# EAGLE design robotshellid (EAGLE 9.6.2)
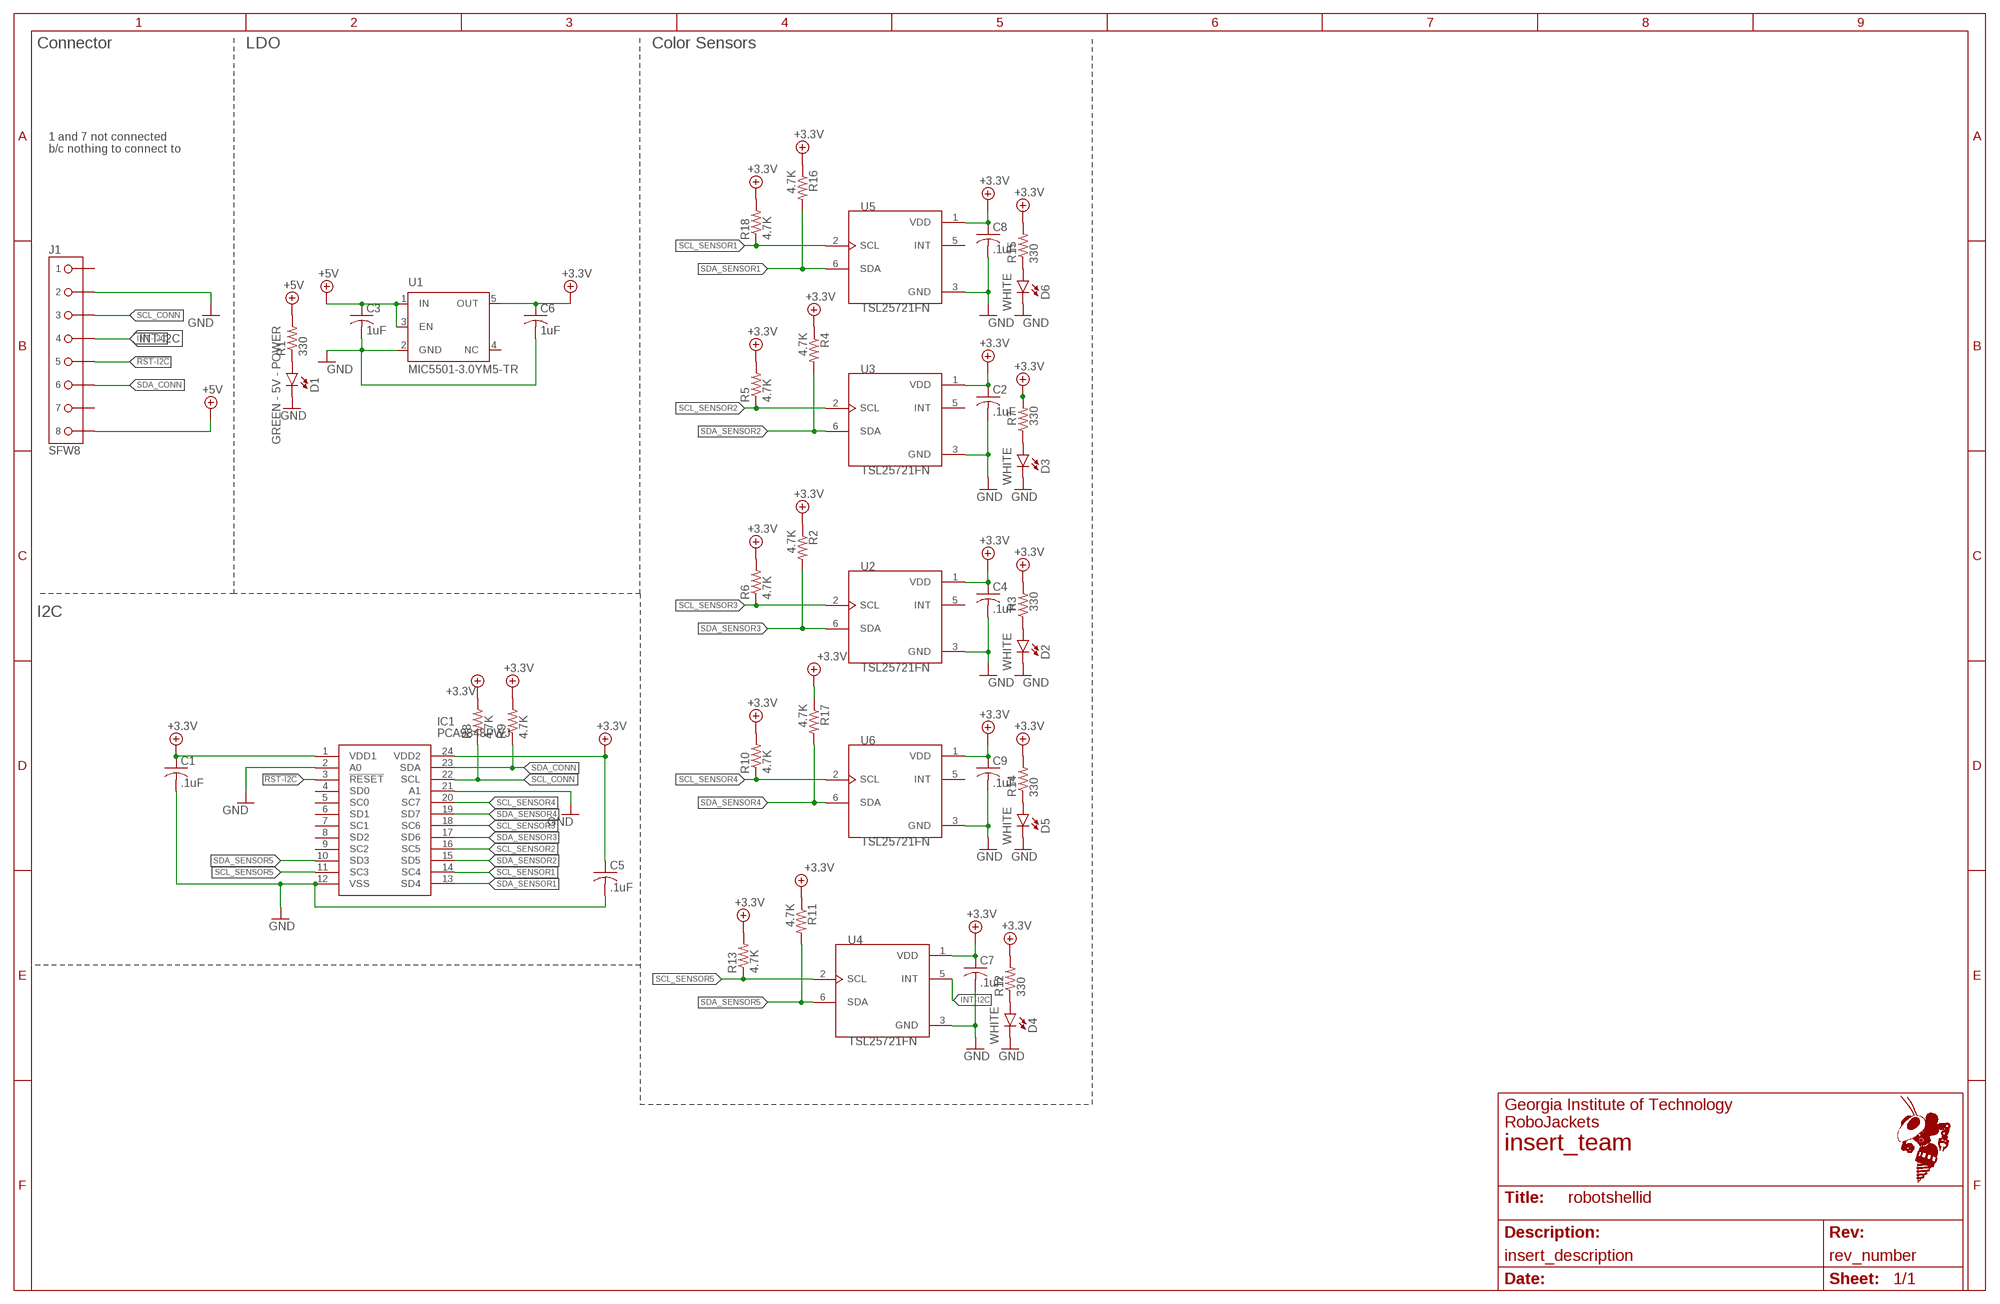
[diagram p0: schematic, sheet 1]
FRAME1 (FRAME_11_17): REVISION: rev_number; SCH_DESC: insert_description; TEAM: insert_team

## Parts
C1  .1uF  C-USC0603  [C0603]
C2  .1uF  C-USC0603  [C0603]
C3  1uF  C-USC0603  [C0603]
C4  .1uF  C-USC0603  [C0603]
C5  .1uF  C-USC0603  [C0603]
C6  1uF  C-USC0603  [C0603]
C7  .1uF  C-USC0603  [C0603]
C8  .1uF  C-USC0603  [C0603]
C9  .1uF  C-USC0603  [C0603]
D1  GREEN - 5V - POWER  LED-SMD  [LED0603]
D2  WHITE  LED-SMD  [LED0603]
D3  WHITE  LED-SMD  [LED0603]
D4  WHITE  LED-SMD  [LED0603]
D5  WHITE  LED-SMD  [LED0603]
D6  WHITE  LED-SMD  [LED0603]
IC1  PCA9848PWJ  [SOP65P640X110-24N]
J1  SFW8  [SFW8R-1ST]
R1  330  R-US_R0603  [R0603]
R2  4.7K  R-US_R0603  [R0603]
R3  330  R-US_R0603  [R0603]
R4  4.7K  R-US_R0603  [R0603]
R5  4.7K  R-US_R0603  [R0603]
R6  4.7K  R-US_R0603  [R0603]
R7  330  R-US_R0603  [R0603]
R8  4.7K  R-US_R0603  [R0603]
R9  4.7K  R-US_R0603  [R0603]
R10  4.7K  R-US_R0603  [R0603]
R11  4.7K  R-US_R0603  [R0603]
R12  330  R-US_R0603  [R0603]
R13  4.7K  R-US_R0603  [R0603]
R14  330  R-US_R0603  [R0603]
R15  330  R-US_R0603  [R0603]
R16  4.7K  R-US_R0603  [R0603]
R17  4.7K  R-US_R0603  [R0603]
R18  4.7K  R-US_R0603  [R0603]
U1  MIC5501-3.0YM5-TR  [SOT-23-5]
U2  TSL25721FN  [SON65P200X200X70-6N]
U3  TSL25721FN  [SON65P200X200X70-6N]
U4  TSL25721FN  [SON65P200X200X70-6N]
U5  TSL25721FN  [SON65P200X200X70-6N]
U6  TSL25721FN  [SON65P200X200X70-6N]

## Nets
!RST-I2C!: IC1.3(!RESET) J1.5
+3.3V: C1.1 C2.1 C4.1 C5.1 C6.1 C7.1 C8.1 C9.1 IC1.1(VDD1) IC1.24(VDD2) R2.1 R3.2 R4.1 R5.2 R6.2 R7.2 R8.2 R9.2 R10.2 R11.1 R12.2 R13.2 R14.2 R15.2 R16.1 R17.1 R18.2 U1.5(OUT) U2.1(VDD) U3.1(VDD) U4.1(VDD) U5.1(VDD) U6.1(VDD)
+5V: C3.1 J1.8 R1.2 U1.1(IN) U1.3(EN)
GND: C1.2 C2.2 C3.2 C4.2 C5.2 C6.2 C7.2 C8.2 C9.2 D1.C D2.C D3.C D4.C D5.C D6.C IC1.2(A0) IC1.12(VSS) IC1.21(A1) J1.2 U1.2(GND) U2.3(GND) U3.3(GND) U4.3(GND) U5.3(GND) U6.3(GND)
INT-I2C: J1.4 U4.5(INT)
N$1: D6.A R15.1
N$3: D3.A R7.1
N$4: D4.A R12.1
N$5: D2.A R3.1
N$7: D5.A R14.1
N$9: D1.A R1.1
SCL_CONN: IC1.22(SCL) J1.3 R8.1
SCL_SENSOR1: IC1.14(SC4) R18.1 U5.2(SCL)
SCL_SENSOR2: IC1.16(SC5) R5.1 U3.2(SCL)
SCL_SENSOR3: IC1.18(SC6) R6.1 U2.2(SCL)
SCL_SENSOR4: IC1.20(SC7) R10.1 U6.2(SCL)
SCL_SENSOR5: IC1.11(SC3) R13.1 U4.2(SCL)
SDA_CONN: IC1.23(SDA) J1.6 R9.1
SDA_SENSOR1: IC1.13(SD4) R16.2 U5.6(SDA)
SDA_SENSOR2: IC1.15(SD5) R4.2 U3.6(SDA)
SDA_SENSOR3: IC1.17(SD6) R2.2 U2.6(SDA)
SDA_SENSOR4: IC1.19(SD7) R17.2 U6.6(SDA)
SDA_SENSOR5: IC1.10(SD3) R11.2 U4.6(SDA)
Unconnected: IC1.4(SD0) IC1.5(SC0) IC1.6(SD1) IC1.7(SC1) IC1.8(SD2) IC1.9(SC2) J1.1 J1.7 J1.LEG1 J1.LEG2 U1.4(NC) U2.5(INT) U3.5(INT) U5.5(INT) U6.5(INT)

## Notes on the sheet
- Connector | LDO | Color Sensors
- 1 and 7 not connected
  b/c nothing to connect to
- I2C

## Library data of the parts
C1-C9 = rcl:C-US: CAPACITOR, American symbol; SPICEPREFIX: C
D1-D6 = RoboJackets-LEDs:LED-SMD: Series of 0603 LEDs
IC1 = SamacSys_Parts:PCA9848PWJ: NXP - PCA9848PWJ - SWITCH, DUAL, 8:1, TSSOP-24 Source: Datasheet <http://www.nxp.com/docs/en/data-sheet/PCA9848.pdf>; DESCRIPTION: NXP - PCA9848PWJ - SWITCH, DUAL, 8:1, TSSOP-24; HEIGHT: 1.1mm; MANUFACTURER_NAME: NXP; MANUFACTURER_PART_NUMBER: PCA9848PWJ; MOUSER_PART_NUMBER: 771-PCA9848PWJ; MOUSER_PRICE-STOCK: https://www.mouser.co.uk/ProductDetail/NXP-Semiconductors/PCA9848PWJ?qs=%252BRKXB2WKlSeUIK8RAkv%2F8w%3D%3D
J1 = RoboJackets-Connectors:SFW8
R1-R18 = rcl:R-US_: RESISTOR, American symbol; SPICEPREFIX: R
U1 = RoboJackets-PowerICs:MIC5501-3.0YM5-TR: Linear Voltage Regulator IC 1 Output 300mA SOT-23-5 Datasheet <https://ww1.microchip.com/downloads/en/DeviceDoc/MIC5501-02-03-04-300mA-Single-Output-LDO-in-Small-Packages-DS20006006B.pdf>; DKPN: 576-4905-1-ND
U2-U6 = TSL25721FN:TSL25721FN: Ic Light To Dgtl Conv Als 6dfn Check prices <https://pricing.snapeda.com/parts/TSL25721FN/ams/view-part?ref=eda>; AVAILABILITY: In Stock; DESCRIPTION: Optical Sensor Ambient 4000K I²C 6-WDFN; MF: ams; MP: TSL25721FN; PACKAGE: DFN-6 ams; PRICE: None; PURCHASE-URL: https://pricing.snapeda.com/search/part/TSL25721FN/?ref=eda

## Board
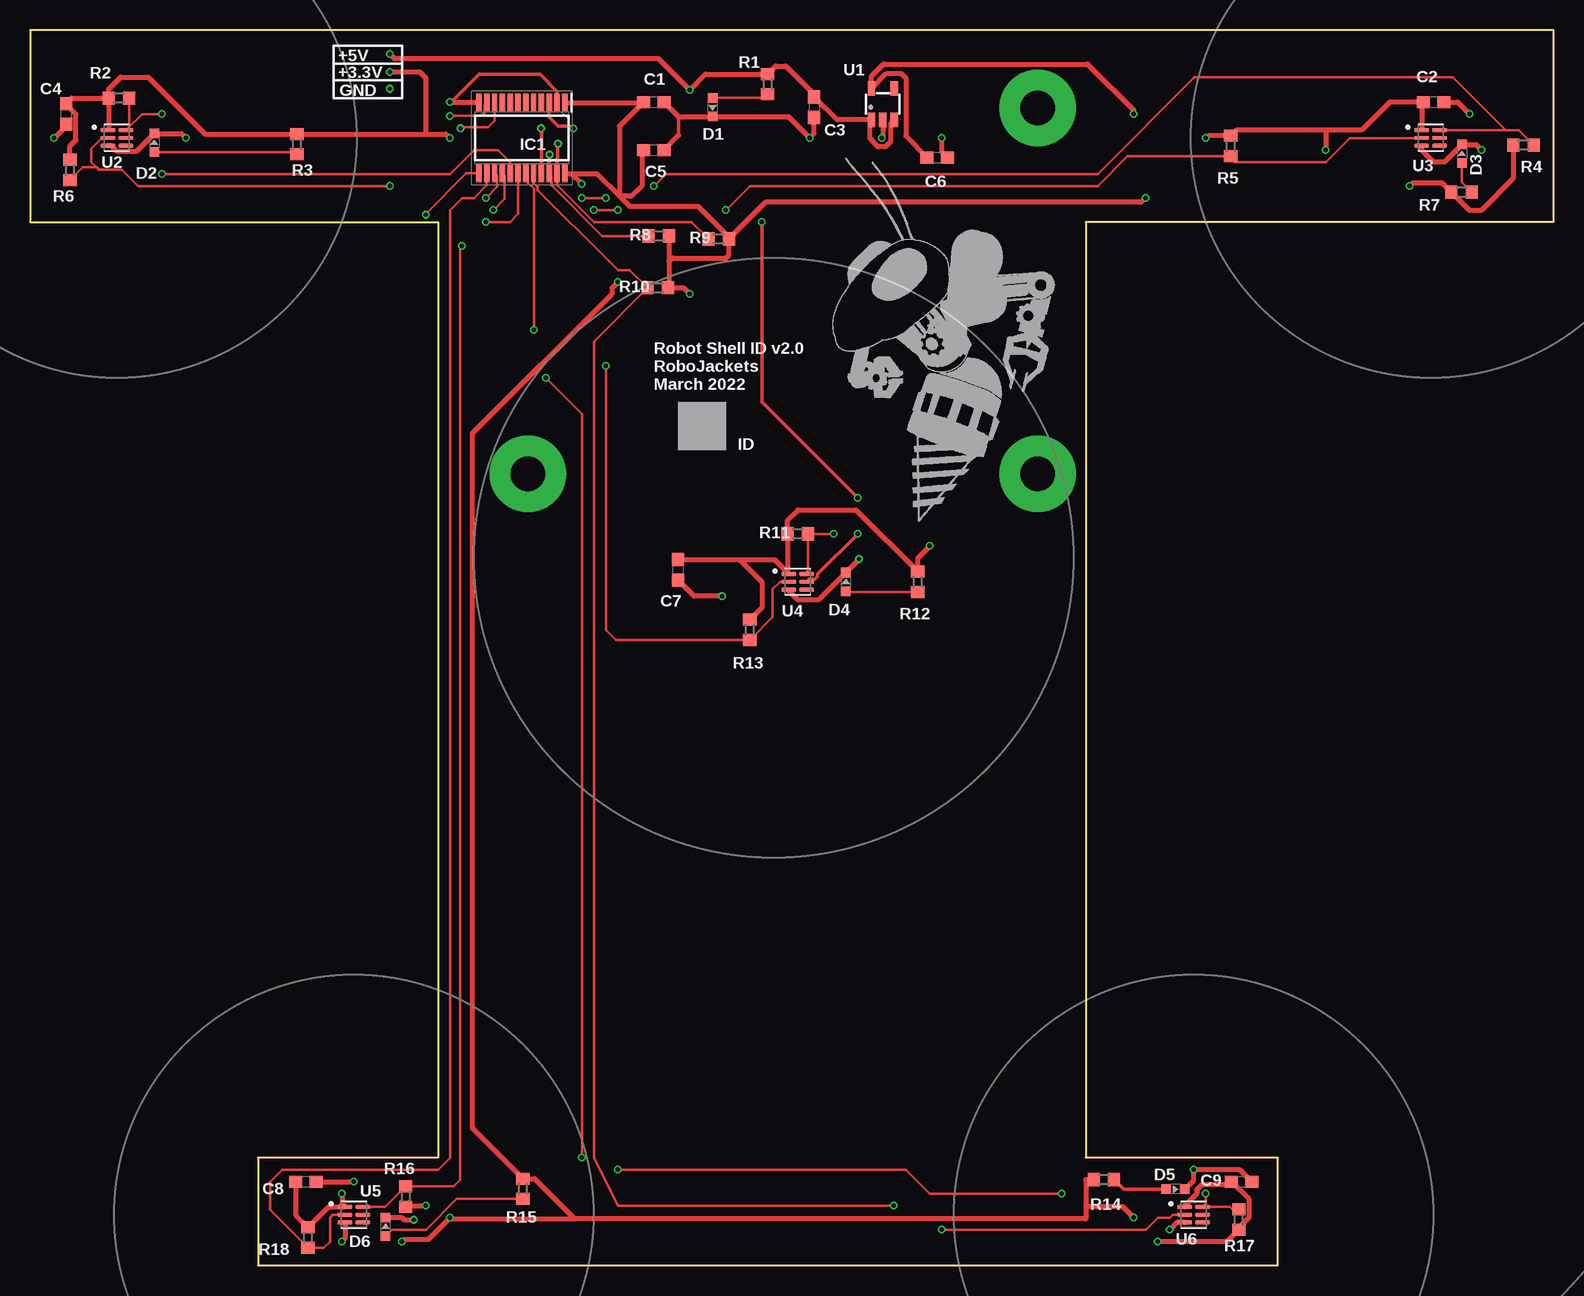
[diagram p1: board, top side]
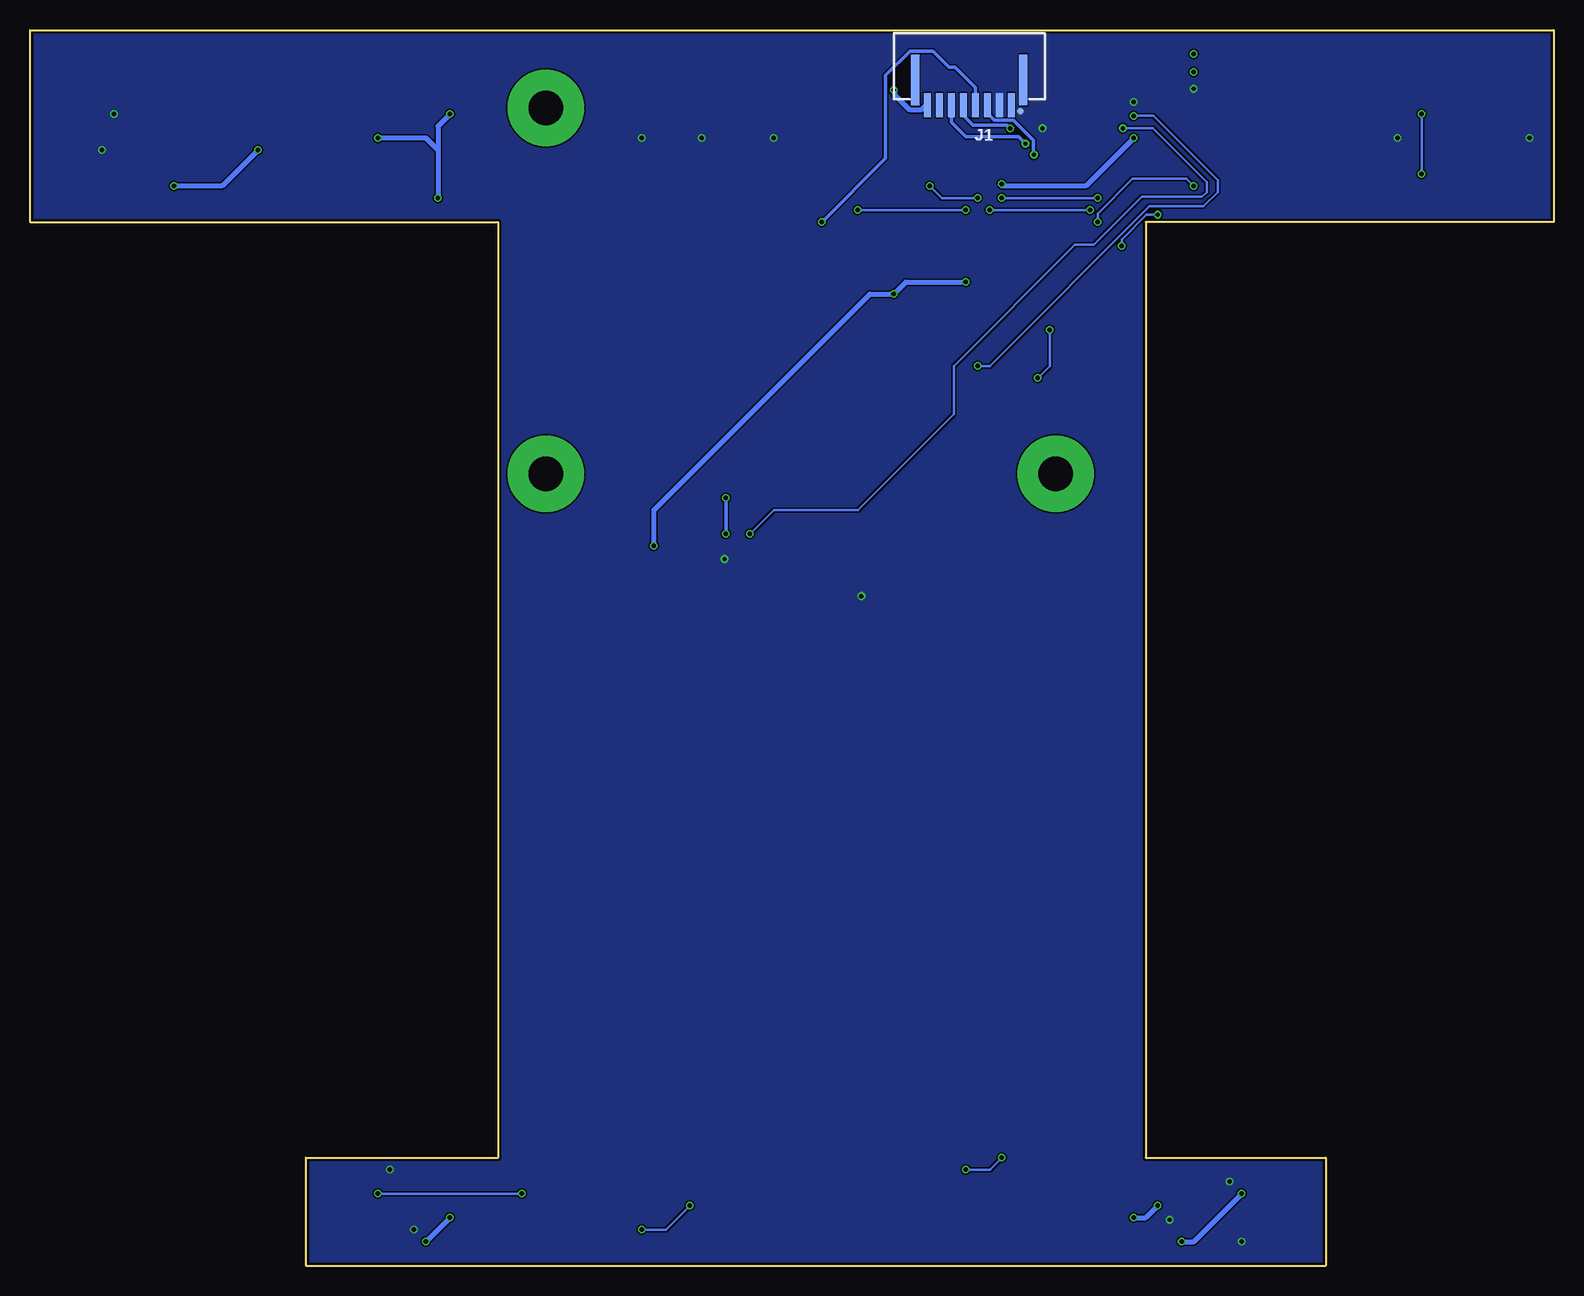
[diagram p2: board, bottom side, seen from below]

Size 127 x 103 mm. Coordinates in mm from the lower left corner, seen from the top.
Outline: 127,87 127,103 0,103 0,87 34,87 34,9 19,9 19,0 104,0 104,9 88,9 88,87 127,87
Copper layers (1+16): Top 0.035mm / dielectric 1.53mm / Bottom 0.035mm
Design rules "JLCPCB (2 Layer)": minimum track width 5mil, minimum drill 0.3mm, track to track 5mil, track to pad 5mil, pad to pad 5mil, via to via 20mil, smd to smd 5mil, copper to edge 0.2mm, drill to drill 21mil, minimum pad ring 6mil, minimum via ring 6mil, stop-mask expansion 2mil, vias tented up to drill 30mil, thermal gap 10mil

### Footprints (pad centres in the part's own frame; a part is rotated, then mirrored left to right if it is on the bottom)
C0603 = smd 1.1 x 1: 1 -0.85,0; 2 0.85,0
LED0603 = smd 0.8 x 0.8: A -0.775,0; C 0.775,0
SOP65P640X110-24N = smd 1.475 x 0.45: 1 -2.938,3.575; 2 -2.938,2.925; 3 -2.938,2.275; 4 -2.938,1.625; 5 -2.938,0.975; 6 -2.938,0.325; 7 -2.938,-0.325; 8 -2.938,-0.975; 9 -2.938,-1.625; 10 -2.938,-2.275; 11 -2.938,-2.925; 12 -2.938,-3.575; 13 2.938,-3.575; 14 2.938,-2.925; 15 2.938,-2.275; 16 2.938,-1.625; 17 2.938,-0.975; 18 2.938,-0.325; 19 2.938,0.325; 20 2.938,0.975; 21 2.938,1.625; 22 2.938,2.275; 23 2.938,2.925; 24 2.938,3.575
SFW8R-1ST = smd 0.6 x 2: 1 -3.5,3.25; 2 -2.5,3.25; 3 -1.5,3.25; 4 -0.5,3.25; 5 0.5,3.25; 6 1.5,3.25; 7 2.5,3.25; 8 3.5,3.25 | smd 0.7 x 4.2: LEG1 -4.5,1.15; LEG2 4.5,1.15
R0603 = smd 1 x 1.1: 1 -0.85,0; 2 0.85,0
SOT-23-5 = smd 0.6 x 1.2: 1 -0.95,-1.306; 2 0,-1.306; 3 0.95,-1.306; 4 0.95,1.306; 5 -0.95,1.306
SON65P200X200X70-6N = smd 1.24 x 0.32: 1 -0.745,0.65; 2 -0.745,0; 3 -0.745,-0.65; 4 0.745,-0.65; 5 0.745,0; 6 0.745,0.65

### Placement (x,y rotation side)
C1  52,97 0 top
C2  117,97 0 top
C3  65.37,96.56 270 top
C4  3,96 270 top
C5  52,93 0 top
C6  75.63,92.37 0 top
C7  54,58 270 top
C8  23,7 0 top
C9  101,7 0 top
D1  56.9,96.56 270 top
D2  10.36,93.6 90 top
D3  119.36,92.68 90 top
D4  68,57 90 top
D5  95.48,6.36 0 top
D6  29.64,3.24 90 top
IC1  41,94 270 top
J1  48.7,100 180 bottom
R1  61.49,98.48 90 top
R2  7.41,97.32 0 top
R3  22.25,93.48 90 top
R4  124.49,93.4 0 top
R5  100.09,93.32 90 top
R6  3.33,91.32 90 top
R7  119.33,89.48 180 top
R8  52.4,85.83 0 top
R9  57.4,85.59 0 top
R10  52.32,81.51 0 top
R11  64,61 0 top
R12  74,57 90 top
R13  60,53 90 top
R14  89.52,7.17 180 top
R15  41.09,6.4 90 top
R16  31.32,5.75 90 top
R17  100.76,3.82 90 top
R18  23.17,2.32 90 top
U1  71.09,96.81 0 top
U2  7.24,94 0 top
U3  116.76,94 0 top
U4  64,57 0 top
U5  27,4.24 0 top
U6  97,4.24 0 top
U$1  [ROBOBUZZ_1.4X]  74,62 0 top

### Tracks (layer width: path | path; a pad name or v marks a point on that pad's centre or on a via)
!RST-I2C!  (via drill 0.35)
  Top 0.3: v45.29,94.79 45.08,95 44,95 43.27,95.72 IC1.3
  Bottom 0.3: v45.29,94.79 45.55,95.05 48.39,95.05 49.2,95.86 J1.5
+3.3V  (via drill 0.35)
  Top 0.4: 108,94.65 111,94.65 113.35,97 C2.1 116.02,96.87 U3.1 | 108,94.65 100.57,94.65 R5.2 98.17,94.17 v98,94 | R9.2 58.25,84.25 58,84 53.58,84 53.29,83.71 53.25,83.75 | 45.41,3.89 42.04,7.25 R15.2 36.89,11.45 36.89,69.39 48.5,81 48.5,81.5 v49,82 | 34.94,3.89 35.02,3.98 v35,4 | 34.94,3.89 33.23,2.18 31.18,2.18 v31,2 | v92,96 92,96.33 88.17,100.17 71.17,100.17 70.14,99.14 U1.5 71.41,99.39 72.61,99.39 73,99 73,94.15 C6.1 | R9.2 61.29,88.63 92.63,88.63 v93,89 | v55,81 54.49,81.51 R10.2 53.25,81.59 53.25,83.75 | 108,94.65 v108,93 | v115,90 115.24,90.24 117.72,90.24 R7.2 119.96,88 121,88 123.64,90.64 R4.1 | R2.1 6.56,98.08 7.56,99.07 9.84,99.07 14.59,94.33 R3.2 33,94.33 | R9.2 58.25,85.75 55.72,88.28 50,88.28 49.14,89.14 | 33,94.33 34.67,94.33 v35,94 | 88,4.89 91.11,4.89 v92,4 | 45.41,3.89 88,3.89 88,4.89 | R14.2 88,7.16 88,4.89 | 49.14,89.14 47.28,91 45.16,91 | R8.2 53.25,83.75 | v33,5 31.42,5 R16.1 | 34.94,3.89 45.41,3.89 | v94,2 99.79,2 R17.1 100.76,3.15 101.64,4.03 101.64,5.51 C9.1 99.88,6.73 97.7,6.73 97.27,6.3 97.27,6 96.26,4.99 U6.1 | C8.1 22.15,4.19 R18.2 24.89,4.89 U5.1 26,5.14 v26,6 | C5.1 51,92.85 51,90 50.14,89.14 49.14,89.14 | R2.1 3.47,97.32 C4.1 3.83,96.02 3.83,93.79 3.33,93.29 R6.2 | 49.14,89.14 49.14,94.99 C1.1 51.09,96.94 IC1.1 | IC1.24 44.64,91 45.16,91 | R2.1 6.56,94.72 U2.1 | v46,90.16 45.16,91 | 33,94.33 33,99 32.5,99.5 v30,99.5 | 63.15,57.76 62.05,58.85 C7.1 59.15,58.85 61,57 61,54.85 R13.2 | v75,60 74,59 R12.2 68.85,63 64,63 63.15,62.15 R11.1 63.15,57.76 | 63.15,57.76 U4.1
  Bottom 0.4: v49,82 54,82 v55,81 57,81 75,63 v75,60 | v108,93 111,90 v115,90 | v31,2 30,2 v26,6 | v94,2 v92,4 | v35,4 34,4 v33,5 | v92,96 93,95 93,93 | 93,93 v93,89 | 93,93 94,94 v98,94 | v46,90.16 46,90 39,90 v35,94
+5V  (via drill 0.35)
  Top 0.4: U1.1 70,95.5 | 70,95.5 67.28,95.5 C3.1 65.37,97.63 63,100 62.16,100 R1.2 56.33,99.33 v55,98 52.4,100.6 30.4,100.6 v30,101 | U1.3 71.73,95.2 71.73,93.7 71.3,93.27 70.7,93.27 70.27,93.7 70.27,93.73 70,94 70,95.5
  Bottom 0.4: v55,98 54.93,97.93 54.93,97.59 53.71,96.37 52.69,96.37 52.32,96.75 J1.8
BOLT1  (via drill 2.85 pad 6.4)
  other vias: 84,96.5
BOLT2  (via drill 2.85 pad 6.4)
  other vias: 84,66
BOLT3  (via drill 2.85 pad 6.4)
  other vias: 41.5,66
GND  (via drill 0.35)
  Top 0.2: 63.26,56.24 U4.3
  Top 0.3: IC1.21 42.62,94.78 v42.6,94.8 | IC1.2 43.92,97.88 42.5,99.3 37.42,99.3 35.06,96.94 | 54.06,94.22 54.06,95.78
  Top 0.4: C3.2 65.37,94.37 v65,94 63.22,95.78 D1.C 54.06,95.78 C1.2 | U1.2 71.09,94.09 v71,94 | C6.2 76,92.85 v76,94 | D5.C 97,7.1 v97,8 100.85,8 C9.2 | v121,93 120.55,93.45 D3.C 117.91,92 117,92 116.02,92.98 U3.3 | v13,94 12.62,94.38 D2.C 8.85,92.86 7.27,92.86 6.78,93.35 U2.3 | D6.C 30.98,4.02 31.18,3.82 v32,3.82 | IC1.12 35.06,96.94 v35,97 | C5.2 54.06,94.22 | C4.2 3,95 v2,94 | U5.3 26.25,2.25 v26,2 | C8.2 v27,7 | U6.3 95.59,3.59 v95,3 | C2.2 119,97 v120,96 | 63.26,56.24 64,55.5 65.72,55.5 D4.C 69.1,58.88 v69.1,58.9 | v57.7,55.8 55.35,55.8 C7.2
  other vias: 30,98.1
  pour Bottom (no thermals): 0,103 127,103 127,87 88,87 88,9 104,9 104,0 19,0 19,9 34,9 34,87 0,87
INT-I2C  (via drill 0.35)
  Top 0.3: U4.5 64.96,57.21 65.43,57.21 65.64,57.42 65.64,57.64 v69,61 | v69,64 61,72 v61,87
  Bottom 0.3: v69,61 v69,64 | v61,87 55.68,92.32 55.68,99.21 53.66,101.23 51.73,101.23 50.41,99.9 49.9,99.9 48.2,98.2 J1.4
N$1
  Top 0.2: D6.A 30.18,3 33,3 35.55,5.55 R15.1
N$3
  Top 0.2: D3.A 119.36,90.3 R7.1
N$4
  Top 0.2: D4.A 68.08,56.15 R12.1
N$5
  Top 0.2: D2.A 22.05,92.83 R3.1
N$7
  Top 0.3: D5.A 91.18,6.36 R14.1
N$9
  Top 0.2: R1.1 61.2,97.34 D1.A
SCL_CONN  (via drill 0.35)
  Top 0.2: IC1.22 43.47,90.86 43.47,90.06 47.71,85.83 R8.1
  Top 0.3: IC1.22 43.27,92.57 v43.31,92.6
  Bottom 0.3: v43.31,92.6 43.34,92.64 43.34,93.81 45.01,95.47 46.62,95.47 47.2,96.06 J1.3
SCL_SENSOR1
  Top 0.2: U5.2 25.24,4.24 25,4 25,2 24.47,1.47 R18.1 20,4.64 20,7 21,8 34,8 35,9 35,88 36,89 37,89 38.08,90.08 IC1.14
SCL_SENSOR2  (via drill 0.35)
  Top 0.2: U3.2 110,94 108,92 100.47,92 100,92.47 | R5.1 100,92.47 | 100,92.47 91.47,92.47 89,90 60,90 v58,88 | v49,88 v47,88 | v38.63,88 39.57,88.94 39.57,90.86 IC1.16
  Bottom 0.2: v58,88 v49,88 | v47,88 v38.63,88
SCL_SENSOR3  (via drill 0.35)
  Top 0.2: U2.2 6,94 5.11,93.11 5.11,92 5.55,91.55 | v30,90 9,90 7.63,91.37 5.74,91.37 5.55,91.55 | R6.1 4.41,91.55 5.55,91.55 | v38,87 40,87 40.67,87.67 IC1.18
  Bottom 0.2: v30,90 30.6,90.6 35.1,90.6 38,87.7 v38,87
SCL_SENSOR4  (via drill 0.35)
  Top 0.2: v72,5 49,5 47,9 47,77.04 R10.1 49.98,83 49,83 48.28,83.72 48.25,83.72 42.33,89.65 42.33,89.89 41.98,90.24 IC1.20 | U6.2 95.25,4.24 95.01,4 94,4 93,3 v76,3
  Bottom 0.2: v76,3 74,3 v72,5
SCL_SENSOR5  (via drill 0.35)
  Top 0.2: U4.2 62.5,57 61.9,56.4 61.9,54.05 R13.1 48.85,52.15 48,53 v48,75 | IC1.11 37.88,96.74 37.88,96.11 37.61,95.84 v35,95.84
  Bottom 0.2: v48,75 47,75 33.7,88.3 29.2,88.3 28,89.5 28,90.5 33.34,95.84 v35,95.84
SDA_CONN  (via drill 0.35)
  Top 0.2: R9.1 55.14,87 47,87 43.92,90.08 IC1.23
  Top 0.3: IC1.23 43.92,92.26 43.99,92.32 43.99,93.49 v44.02,93.53
  Bottom 0.3: v44.02,93.53 44.61,94.11 49,94.11 50.2,95.31 J1.6
SDA_SENSOR1  (via drill 0.35)
  Top 0.2: U5.6 29.61,4.89 R16.2 35.32,6.6 35.86,7.14 35.86,85 v36,85 | IC1.13 36.36,91.06 33,87.7 v33,87.6
  Bottom 0.2: v33,87.6 33.93,87.6 36,85.54 v36,85
SDA_SENSOR2  (via drill 0.35)
  Top 0.2: U3.6 123,94.65 | 123,94.65 124.09,94.65 R4.2 | v52,90 53,91 89,91 97.05,99.05 118.6,99.05 123,94.65 | IC1.15 38.92,90.86 38.92,89.92 v38,89 | v48,89 v46,89
  Bottom 0.2: v52,90 51,89 v48,89 | v46,89 v38,89
SDA_SENSOR3  (via drill 0.35)
  Top 0.2: R2.2 8.26,94.92 U2.6 9.34,96 v11,96 | IC1.17 40.02,91.97 39,93 37,93 35,91 v11,91
  Bottom 0.2: v11,96 v11,91
SDA_SENSOR4  (via drill 0.35)
  Top 0.2: v98,6 98,5.14 U6.6 100,4.89 100.22,4.67 R17.2 | v43,74 46,71 v46,9 | v49,8 73,8 75,6 v86,6 | IC1.19 41.52,90.86 41.52,90.23 42,89.75 v42,78
  Bottom 0.2: v42,78 42,75 v43,74 | v49,8 47,8 v46,9 | v86,6 v98,6
SDA_SENSOR5  (via drill 0.35)
  Top 0.2: 64.85,57.76 R11.2 v67,61 | v35.9,94.8 36,94.9 38.2,94.9 38.73,95.42 IC1.10
  Top 0.4: 64.85,57.76 U4.6
  Bottom 0.2: v67,61 65,63 58,63 50,71 50,75 39.9,85.1 38.3,85.1 34.3,89.1 29.3,89.1 28.9,89.5 28.9,90.3 33.4,94.8 v35.9,94.8

### Text on the board
tPlace: +5V | +3.3V | GND | ID
tNames: Robot Shell ID v2.0 / RoboJackets / March 2022